# EasyEDA Pro project CAN Bus IO Module.epro, board PCB_PCB_Automotive-Dashboard_2025-10-05_1
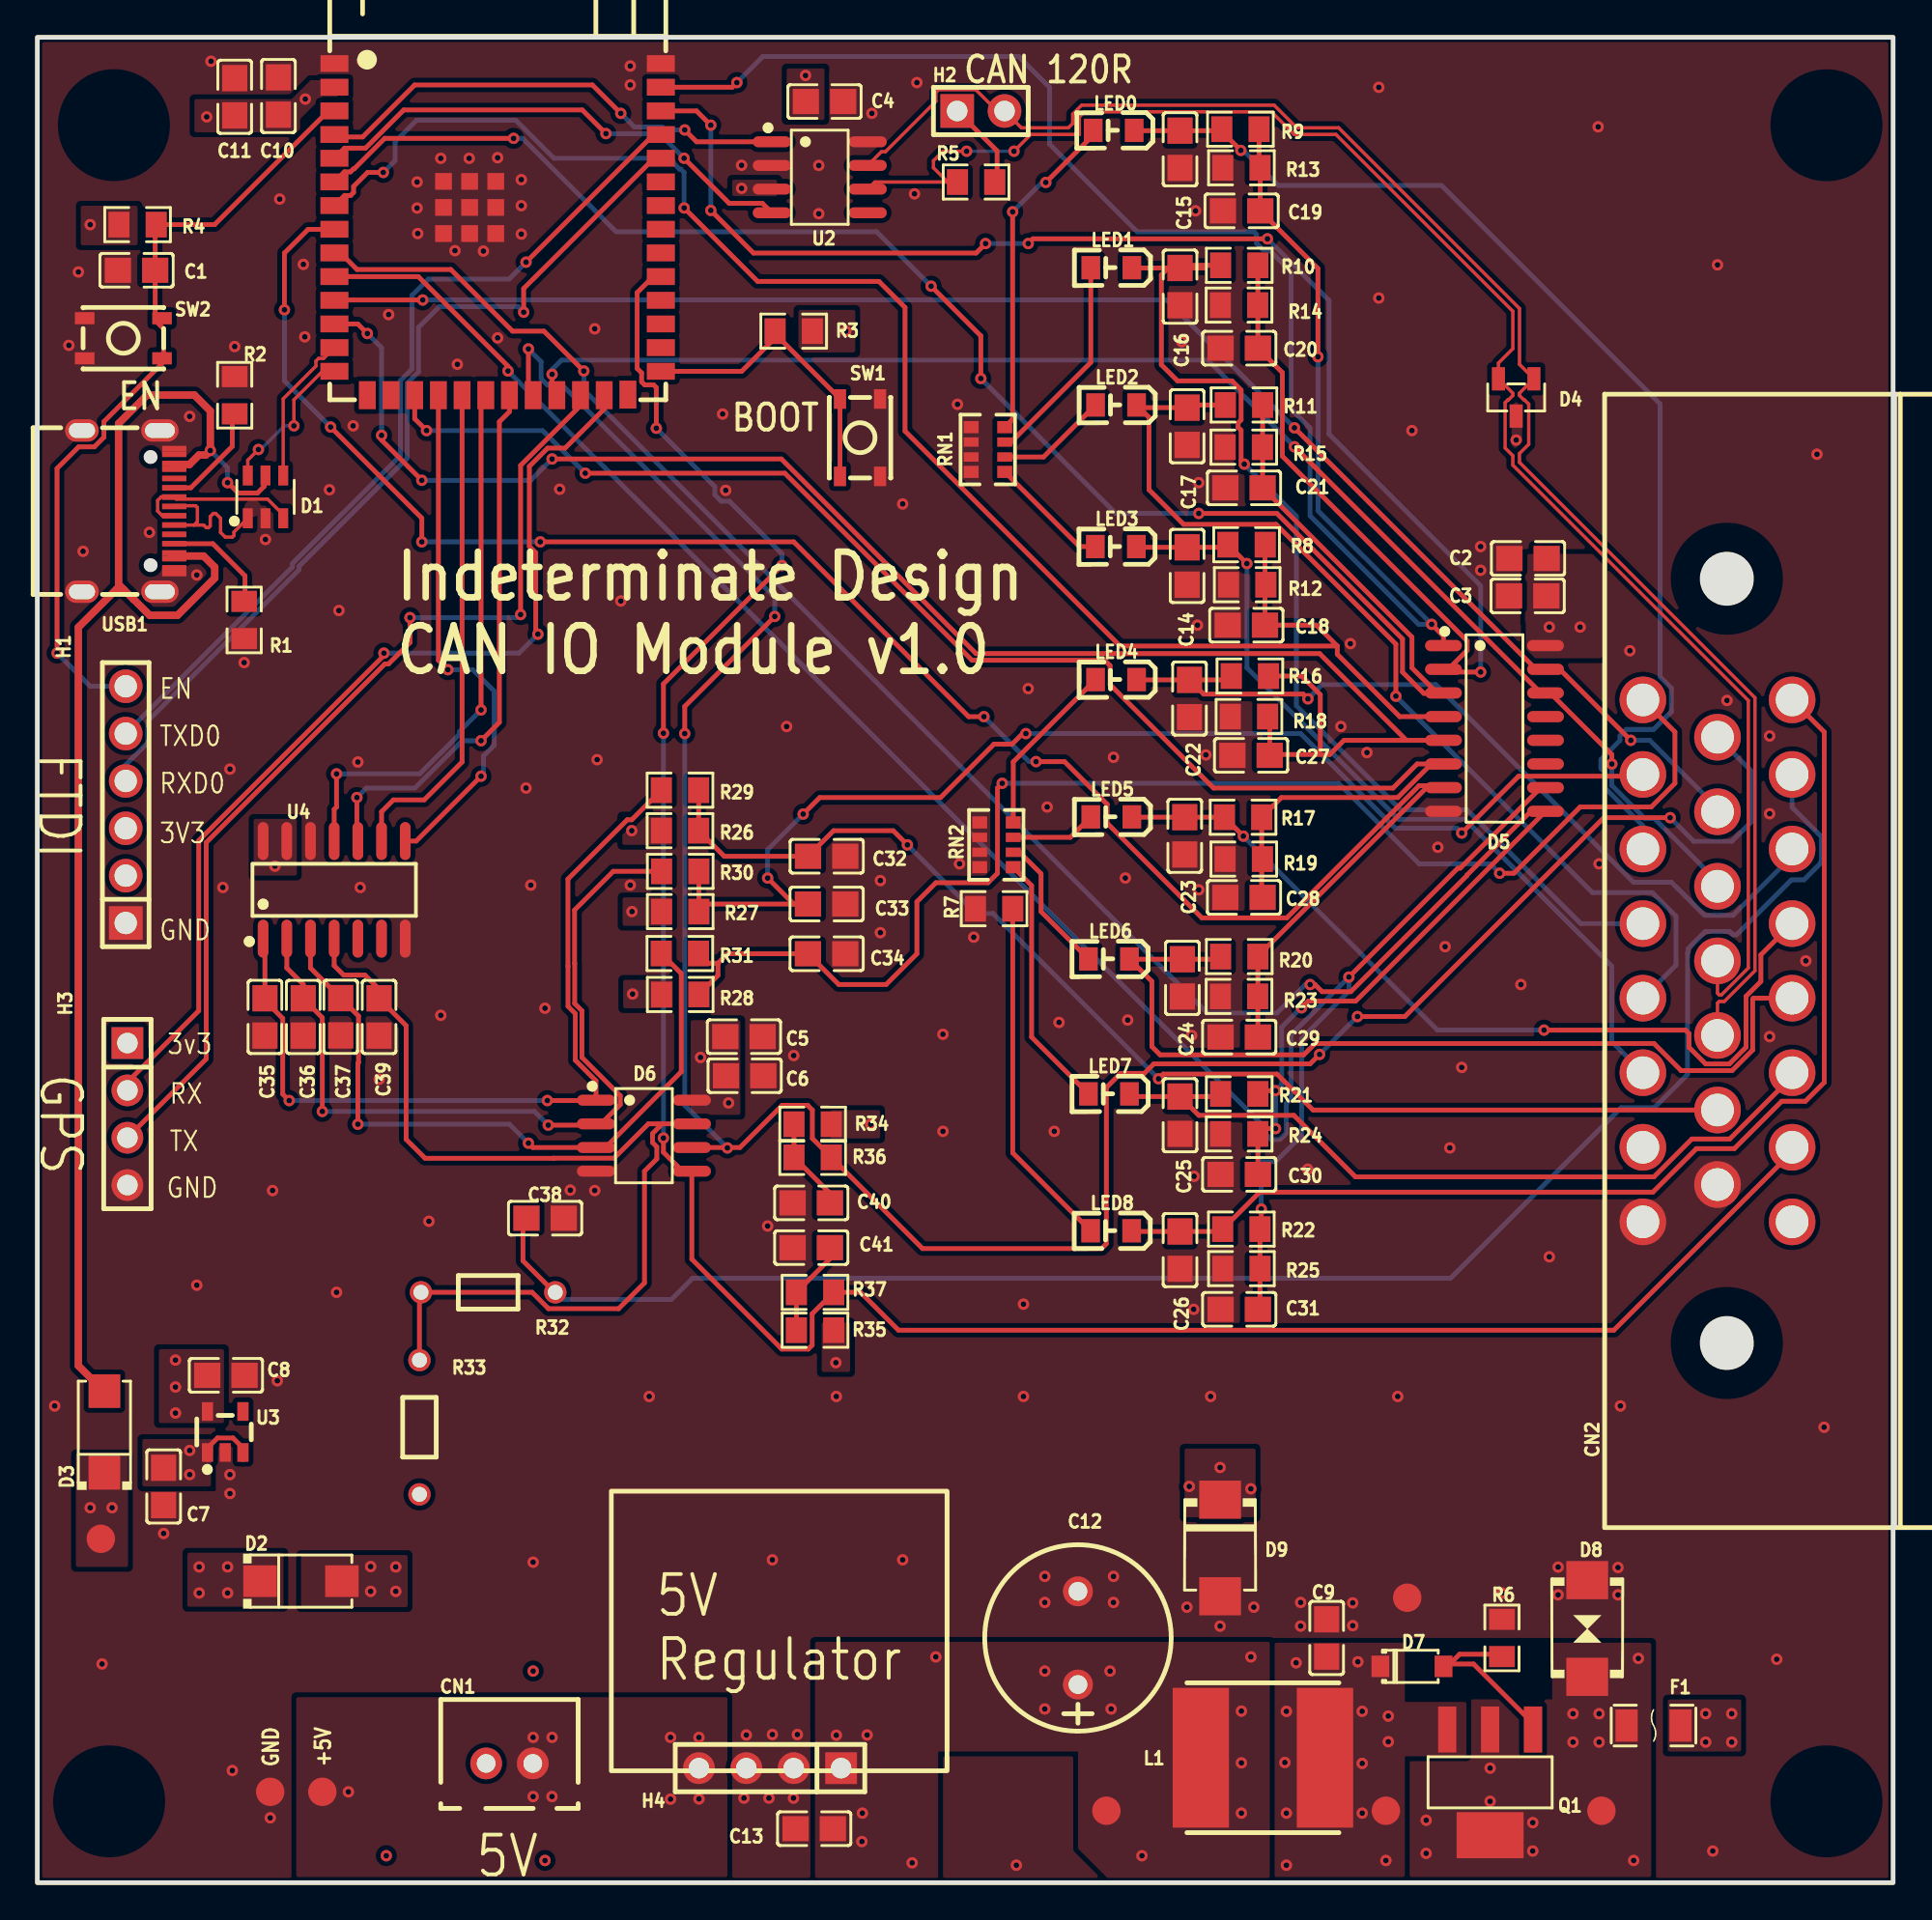
[diagram p6: board, top side]
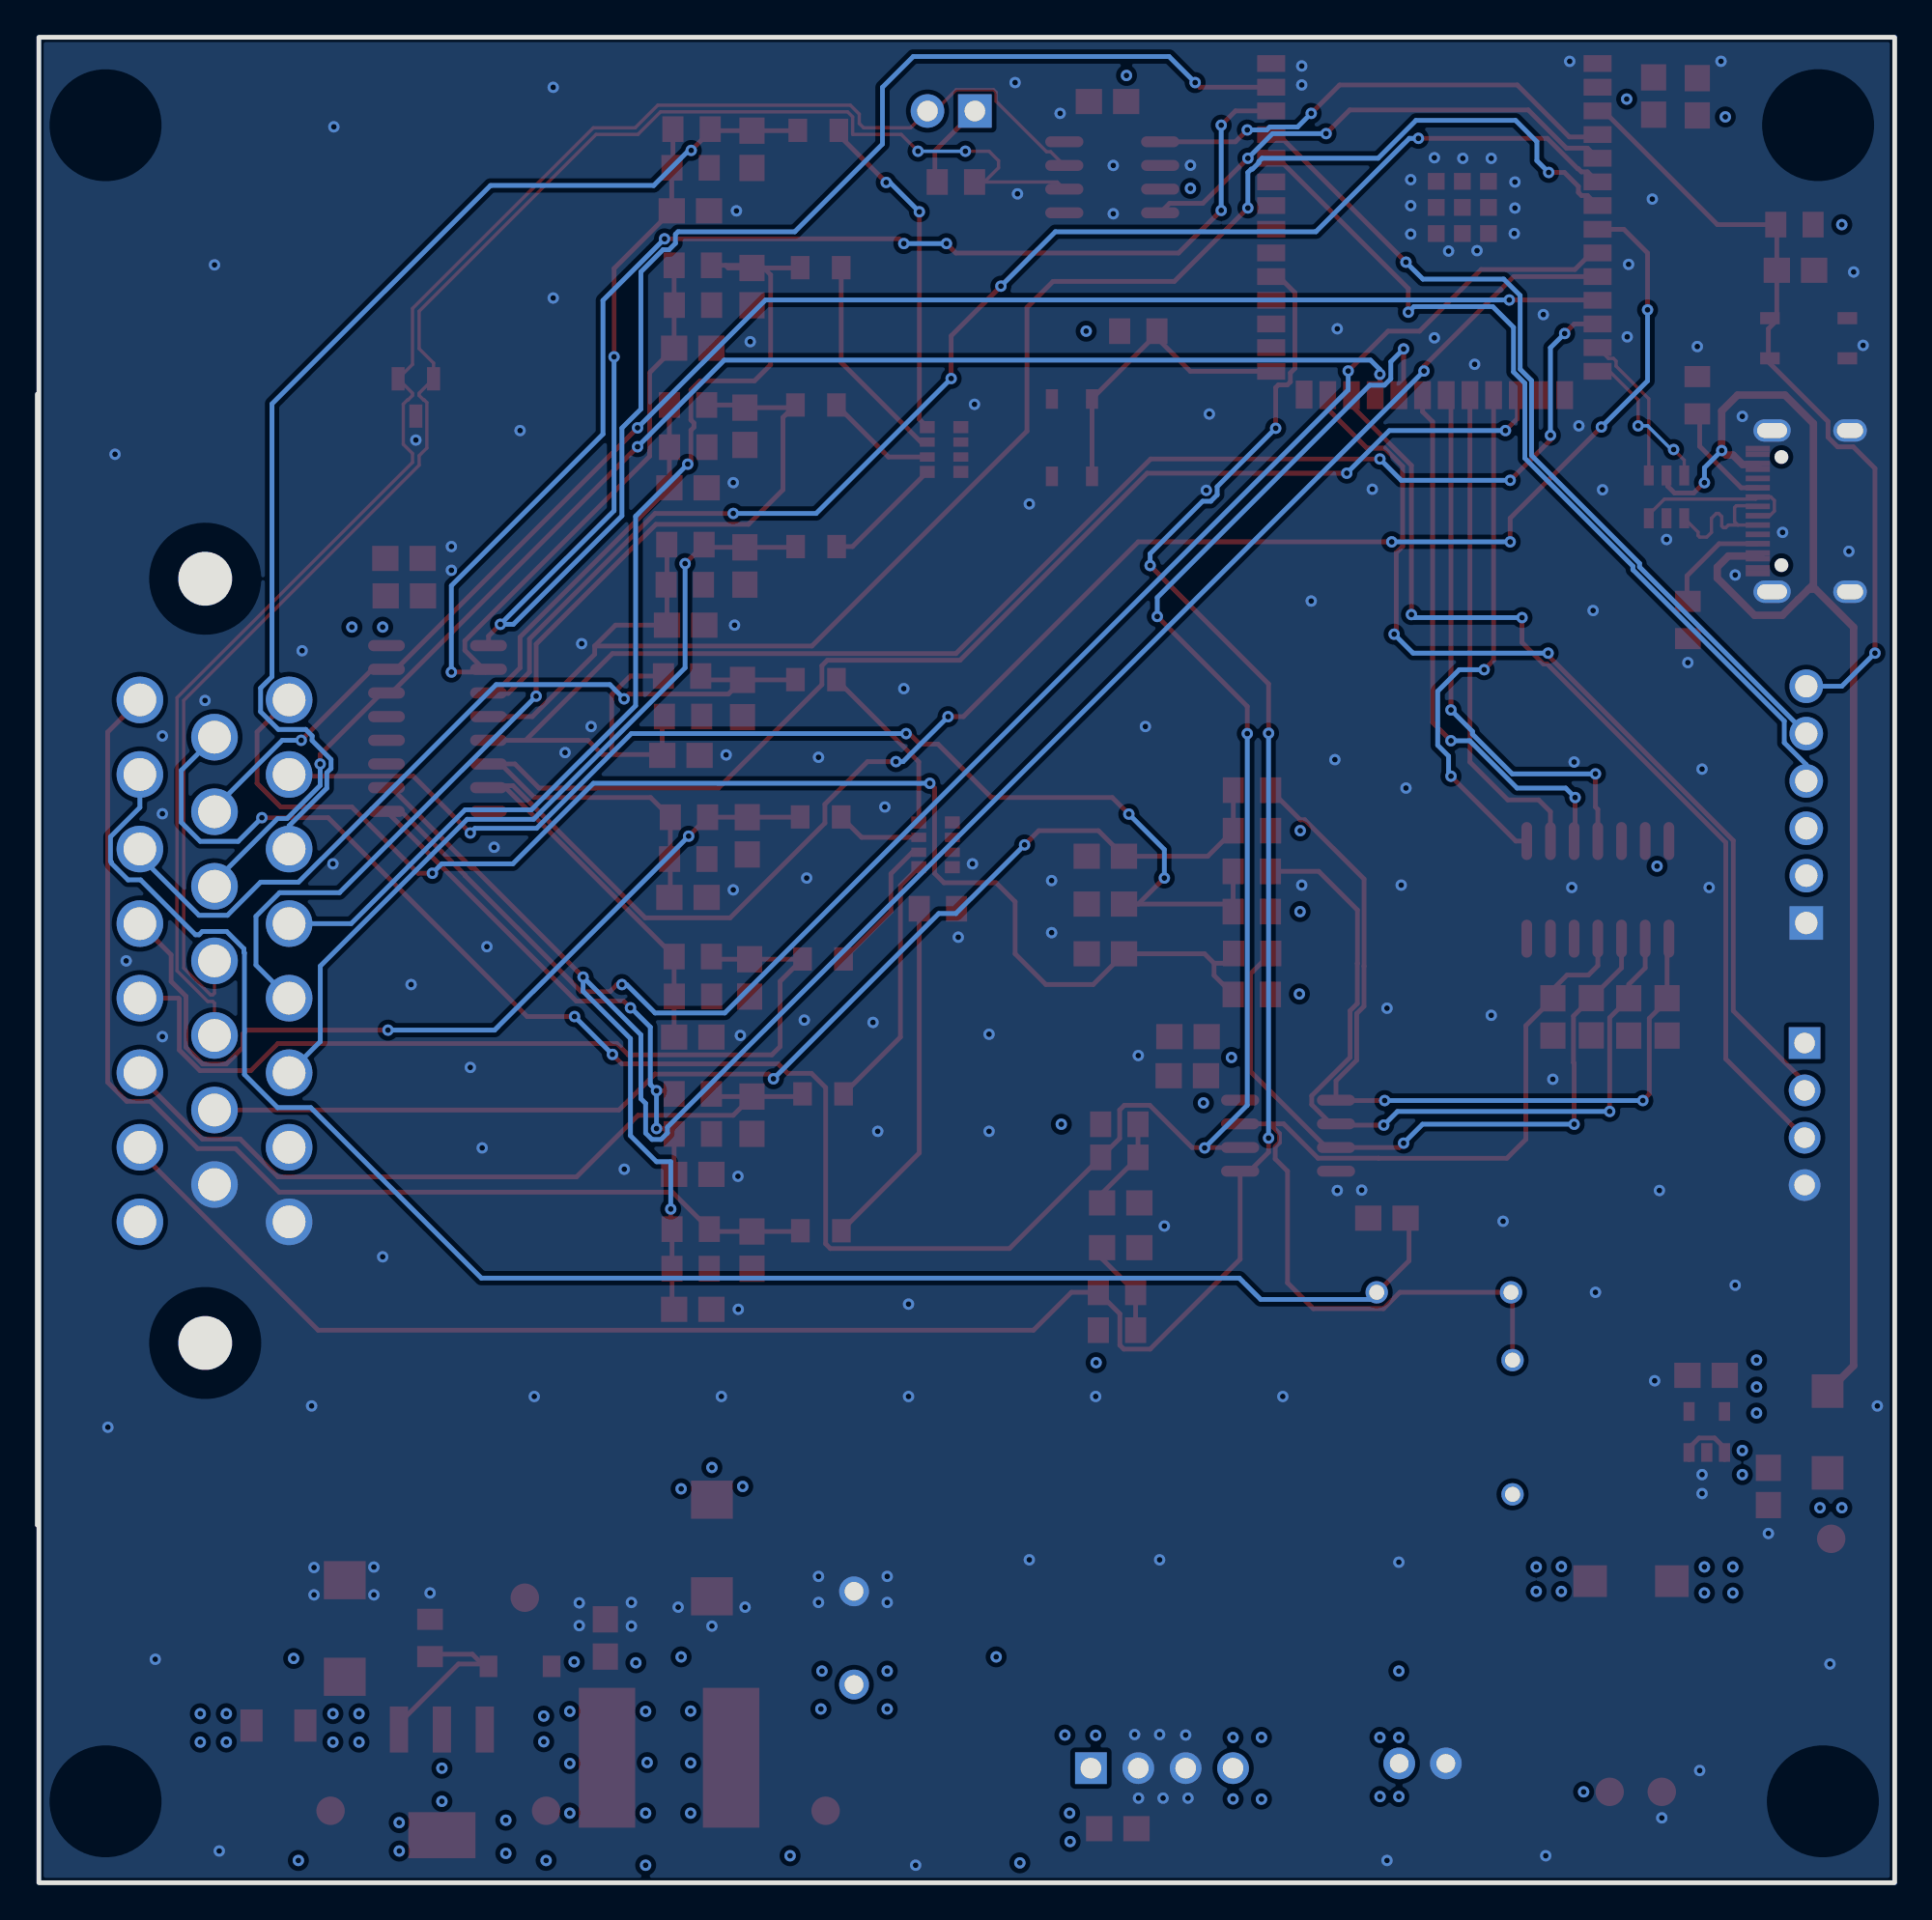
[diagram p7: board, bottom side, seen from below]

Outline 99.58 x 99 mm; copper layers: Top Layer, Inner1, Inner2, Bottom Layer. Coordinates in mm from the lower left corner of the outline.
Outline path: rectangle 0,99 99.5,0
Stack: Top Layer 0.035mm Outer layer thickness 1oz / Dielectric1 0.2104mm 7628 RC49% 8.6mil / Inner1 0.0152mm Inner layer thickness / Dielectric2 1.065mm 1.1mm H/HOZ Copper / Inner2 0.0152mm Inner layer thickness / Dielectric3 0.2104mm 7628 RC49% 8.6mil / Bottom Layer 0.035mm Outer layer thickness 1oz

## Design rules (mm)
net CAN_H: CAN_BUS
net CAN_L: CAN_BUS
net USB_D+: USB_D
net USB_D-: USB_D
net USB_D-_PROTECTED: USB_D_Protected
net USB_D+_PROTECTED: USB_D_Protected
template: Custom Config
spacing copperThickness1oz (default): track to track 0.102, other pairs 0.152 to 0.3
spacing copperThickness2oz: track to track 0.203, other pairs 0.152 to 0.3
track width copperThickness1oz (default): min 0.127, default 0.254, max 2.54
track width copperThickness2oz: min 0.203, default 0.254, max 2.54
track width 12V_High_Current: min 0.5, default 0.5, max 2
differential pair differentialPairCAN (default): width min 0.178, default 0.178, max 0.178; gap min 0.178, default 0.178
via viaSize (default): diameter min 0.5, default 0.61, max 10; hole min 0.3, default 0.305, max 6.3
net +12VIGN uses 12V_High_Current

## Placement (name value [footprint] x y rotation side)
C1  100nF  [C0805]  5.32 86.5 180 top
C2  47uF  [C0805]  79.92 71.04 180 top
C3  100nF  [C0805]  79.91 69.03 180 top
C4  100nF  [C0805]  42.21 95.55 0 top
C5  47uF  [C0805]  37.89 45.39 0 top
C6  100nF  [C0805]  37.92 43.29 0 top
C7  100nF  [C0805]  6.77 21.26 90 top
C8  100nF  [C0805]  10.11 27.22 180 top
C9  100nF  [C0805]  69.13 13.13 270 top
C10  100nF  [C0805]  12.93 95.85 270 top
C11  47uF  [C0805]  10.58 95.81 270 top
C12  220uF  [CAP-TH_BD10.0-P5.00-D0.6-FD_ERG50V220M10X13]  55.8 13.13 90 top
C13  100nF  [C0805]  41.65 2.9 0 top
C14  100nF  [C0805]  61.65 70.64 90 top
C15  100nF  [C0805]  61.27 92.99 90 top
C16  100nF  [C0805]  61.27 85.62 90 top
C17  100nF  [C0805]  61.65 78.13 90 top
C18  220nF  [C0805]  64.82 67.46 0 top
C19  220nF  [C0805]  64.57 89.69 0 top
C20  220nF  [C0805]  64.44 82.32 0 top
C21  220nF  [C0805]  64.7 74.83 0 top
C22  100nF  [C0805]  61.77 63.53 90 top
C23  100nF  [C0805]  61.52 56.16 90 top
C24  100nF  [C0805]  61.39 48.54 90 top
C25  100nF  [C0805]  61.27 41.17 90 top
C26  100nF  [C0805]  61.27 33.94 90 top
C27  220nF  [C0805]  65.08 60.48 0 top
C28  220nF  [C0805]  64.7 52.86 0 top
C29  220nF  [C0805]  64.44 45.37 0 top
C30  220nF  [C0805]  64.44 38 0 top
C31  220nF  [C0805]  64.44 30.76 0 top
C32  100nF  [C0805]  42.32 55.07 180 top
C33  100nF  [C0805]  42.32 52.5 180 top
C34  100nF  [C0805]  42.32 49.84 180 top
C35  220nF  [C0805]  12.2 46.45 90 top
C36  220nF  [C0805]  14.26 46.45 90 top
C37  220nF  [C0805]  16.27 46.45 90 top
C38  100nF  [C0805]  27.23 35.65 180 top
C39  220nF  [C0805]  18.32 46.45 90 top
C40  100nF  [C0805]  41.5 36.47 0 top
C41  100nF  [C0805]  41.5 34.07 0 top
CN1  B2B-XH-A(LF)(SN)  [CONN-TH_B2B-XH-A-LF-SN]  25.31 6.4 0 top
CN2  770669-4  [CONN-TH_23P-P4.00-S4.00_770669-4]  90.08 49.45 90 top
D1  USBLC6-2SC6  [SOT-23-6_L2.9-W1.6-P0.95-LS2.8-BL]  12.23 74.34 0 top
D2  B340A-13-F  [SMA_L4.4-W2.6-LS5.0-RD]  14.14 16.18 0 top
D3  B340A-13-F  [SMA_L4.4-W2.6-LS5.0-RD]  3.6 24.18 90 top
D4  SM24CANB-02HTG  [SOT-23-3_L2.9-W1.3-P1.90-LS2.4-BR]  79.29 79.68 90 top
D5  SP720ABG  [SOIC-16_L9.9-W3.9-P1.27-LS6.0-BL]  78.13 61.92 270 top
D6  SP723ABG  [SOIC-8_L4.9-W3.9-P1.27-LS6.0-BL]  32.52 40.08 270 top
D7  BZT52C15  [SOD-123_L2.8-W1.8-LS3.7-RD]  73.7 11.61 0 top
D8  SMBJ26CA  [SMB_L4.3-W3.6-LS5.4-BI]  83.1 13.64 90 top
D9  SMBJ5.0A  [SMB_L4.3-W3.6-LS5.4-RD]  63.42 17.96 270 top
F1  0466003.NRHF  [F1206]  86.66 8.43 180 top
H1  -  [HDR-TH_6P-P2.54-V-M-1]  4.74 57.84 90 top
H2  -  [HDR-TH_2P-P2.54-V-M-1]  50.59 95.05 0 top
H3  -  [HDR-TH_4P-P2.54-V-M]  4.83 41.24 270 top
H4  -  [HDR-TH_4P-P2.54-V-M]  39.29 6.15 180 top
L1  10uH  [IND-SMD_L8.0-W8.0]  65.71 6.7 0 top
LED0  -  [LED0805-RD]  57.71 94.01 180 top
LED1  -  [LED0805-RD]  57.58 86.64 180 top
LED2  -  [LED0805-RD]  57.84 79.27 180 top
LED3  -  [LED0805-RD]  57.83 71.68 180 top
LED4  -  [LED0805-RD]  57.84 64.54 180 top
LED5  -  [LED0805-RD]  57.58 57.18 180 top
LED6  -  [LED0805-RD]  57.46 49.56 180 top
LED7  -  [LED0805-RD]  57.46 42.32 180 top
LED8  -  [LED0805-RD]  57.57 34.98 180 top
NOREF  -  [Pad_e3829]  72.3 3.86 0 top
NOREF#2  -  [Pad_e7244]  3.41 18.45 0 top
NOREF#3  -  [Pad_e7630]  12.49 4.88 0 top
NOREF#4  -  [Pad_e3830]  57.32 3.86 0 top
NOREF#5  -  [Pad_e7629]  15.28 4.88 0 top
NOREF#6  -  [Pad_e3831]  73.45 15.29 0 top
NOREF#7  -  [Pad_e3828]  83.86 3.86 0 top
Q1  DMP6023LE-13  [SOT-223-4_L6.5-W3.5-P2.30-LS7.0-BR]  77.89 5.38 90 top
R1  5.1kΩ  [R0805]  11.09 67.74 90 top
R2  5.1kΩ  [R0805]  10.58 79.8 90 top
R3  10kΩ  [R0805]  40.55 83.23 0 top
R4  10kΩ  [R0805]  5.38 88.95 0 top
R5  120Ω  [R0805]  50.33 91.24 0 top
R6  100kΩ  [R0805]  78.53 13.13 270 top
R7  4.7kΩ  [R0805]  51.3 52.25 180 top
R8  10kΩ  [R0805]  64.84 71.78 180 top
R9  10kΩ  [R0805]  64.51 94.07 180 top
R10  10kΩ  [R0805]  64.44 86.77 180 top
R11  10kΩ  [R0805]  64.7 79.27 180 top
R12  3.3kΩ  [R0805]  64.87 69.63 180 top
R13  3.3kΩ  [R0805]  64.56 92 180 top
R14  3.3kΩ  [R0805]  64.43 84.63 180 top
R15  3.3kΩ  [R0805]  64.68 77.01 180 top
R16  10kΩ  [R0805]  65.01 64.73 180 top
R17  10kΩ  [R0805]  64.65 57.16 180 top
R18  3.3kΩ  [R0805]  64.96 62.56 180 top
R19  3.3kΩ  [R0805]  64.68 54.91 180 top
R20  10kΩ  [R0805]  64.44 49.68 180 top
R21  10kΩ  [R0805]  64.44 42.32 180 top
R22  10kΩ  [R0805]  64.55 35.06 180 top
R23  3.3kΩ  [R0805]  64.43 47.55 180 top
R24  3.3kΩ  [R0805]  64.44 40.17 180 top
R25  3.3kΩ  [R0805]  64.56 32.94 180 top
R26  2.49kΩ  [R0805]  34.46 56.44 180 top
R27  2.49kΩ  [R0805]  34.47 52.1 180 top
R28  2.49kΩ  [R0805]  34.47 47.65 180 top
R29  470Ω  [R0805]  34.46 58.61 180 top
R30  470Ω  [R0805]  34.47 54.26 180 top
R31  470Ω  [R0805]  34.45 49.85 180 top
R32  220Ω  [RES-TH_BD1.8-L3.2-P7.20-D0.4]  24.17 31.67 180 top
R33  470Ω  [RES-TH_BD1.8-L3.2-P7.20-D0.4]  20.49 24.43 270 top
R34  10kΩ  [R0805]  41.57 40.69 0 top
R35  10kΩ  [R0805]  41.7 29.64 0 top
R36  1kΩ  [R0805]  41.57 38.91 0 top
R37  1kΩ  [R0805]  41.7 31.67 0 top
RN1  4.7kΩ  [RES-ARRAY-SMD_0603-8P-L3.2-W1.6-BL]  50.97 76.89 90 top
RN2  4.7kΩ  [RES-ARRAY-SMD_0603-8P-L3.2-W1.6-BL]  51.43 55.68 90 top
SW1  PTS815SJM250SMTRLFS  [KEY-SMD_4P-L4.2-W3.25-P2.15-TL]  44.11 77.52 270 top
SW2  PTS815SJM250SMTRLFS  [KEY-SMD_4P-L4.2-W3.25-P2.15-TL]  4.61 82.85 0 top
U1  2.4GHz  [WIRELM-SMD_ESP32-S3-WROOM-1]  24.68 88.7 0 top
U2  TCAN332DR  [SOIC-8_L4.9-W3.9-P1.27-LS6.0-BL]  41.95 91.49 270 top
U3  AP2112K-3.3TRG1  [SOT-23-5_L2.9-W1.6-P0.95-LS2.8-BR]  10.08 24.18 270 top
U4  MCP3204-CI/SL  [SOIC-14_L8.7-W3.9-P1.27-LS6.0-BL]  15.92 53.26 0 top
USB1  USB-TYPE-C-018  [USB-C_SMD-TYPE-C-31-M-12]  4.87 73.58 270 top

## Footprints (pads in the part's own frame, mm; a bottom-side part is the same pattern mirrored in y, then rotated)
C0805
  rect 1.41x1.35 smd: 1(-1,0) 2(1,0)
CAP-TH_BD10.0-P5.00-D0.6-FD_ERG50V220M10X13
  round 1.6 hole 1: 1(-2.5,0) 2(2.5,0)
CONN-TH_23P-P4.00-S4.00_770669-4
  round 2.5 hole 1.75: 1(-14,4) 2(-10,4) 3(-6,4) 4(-2,4) 5(2,4) 6(6,4) 7(10,4) 8(14,4) 9(-12,0) 10(-8,0) 11(-4,0) 12(0,0) 13(4,0) 14(8,0) 15(12,0) 16(-14,-4) 17(-10,-4) 18(-6,-4) 19(-2,-4) 20(2,-4) 21(6,-4) 22(10,-4) 23(14,-4)
CONN-TH_B2B-XH-A-LF-SN
  round 1.7 hole 1: 1(1.25,0) 2(-1.25,0)
F1206
  rect 1.19x1.728 smd: 1(-1.445,0) 2(1.445,0)
HDR-TH_2P-P2.54-V-M-1
  rect 1.8x1.8 hole 1.1: 1(-1.27,0)
  round 1.8 hole 1.1: 2(1.27,0)
HDR-TH_4P-P2.54-V-M
  rect 1.7x1.7 hole 1.1: 1(-3.81,0)
  round 1.7 hole 1.1: 2(-1.27,0) 3(1.27,0) 4(3.81,0)
HDR-TH_6P-P2.54-V-M-1
  rect 1.8x1.8 hole 1.2: 1(-6.35,0)
  round 1.8 hole 1.2: 2(-3.81,0) 3(-1.27,0) 4(1.27,0) 5(3.81,0) 6(6.35,0)
IND-SMD_L8.0-W8.0
  rect 3.024x7.5 smd: 1(3.328,0) 2(-3.328,0)
KEY-SMD_4P-L4.2-W3.25-P2.15-TL
  rect 1.05x0.65 smd: 1(-2.075,1.075) 2(2.075,1.075) 3(-2.075,-1.075) 4(2.075,-1.075)
LED0805-RD
  rect 1x1.25 smd: 1(-1.1,0) 2(1.1,0)
Pad_e3828
  round 1.524 smd: 1(0,0)
Pad_e3829
  round 1.524 smd: 1(0,0)
Pad_e3830
  round 1.524 smd: 1(0,0)
Pad_e3831
  round 1.524 smd: 1(0,0)
Pad_e7244
  round 1.524 smd: 2(0,0)
Pad_e7629
  round 1.524 smd: 1(0,0)
Pad_e7630
  round 1.524 smd: 2(0,0)
R0805
  rect 1.133x1.377 smd: 1(-1,0) 2(1,0)
RES-ARRAY-SMD_0603-8P-L3.2-W1.6-BL
  rect 0.65x0.8 smd: 1(-1.2,-0.9) 4(1.2,-0.9) 5(1.2,0.9) 8(-1.2,0.9)
  rect 0.5x0.8 smd: 2(-0.4,-0.9) 3(0.4,-0.9) 6(0.4,0.9) 7(-0.4,0.9)
RES-TH_BD1.8-L3.2-P7.20-D0.4
  round 1.2 hole 0.8: 1(-3.6,0) 2(3.6,0)
SMA_L4.4-W2.6-LS5.0-RD
  rect 1.8x1.7 smd: 1(-2.192,0) 2(2.192,0)
SMB_L4.3-W3.6-LS5.4-BI
  rect 2.047x2.241 smd: 1(-2.591,0) 2(2.591,0)
SMB_L4.3-W3.6-LS5.4-RD
  rect 2.047x2.241 smd: 1(-2.591,0) 2(2.591,0)
SOD-123_L2.8-W1.8-LS3.7-RD
  rect 0.95x1.15 smd: 1(-1.692,0) 2(1.692,0)
SOIC-8_L4.9-W3.9-P1.27-LS6.0-BL
  oval 0.588x2.045 smd: 1(-1.905,-2.57) 2(-0.635,-2.57) 3(0.635,-2.57) 4(1.905,-2.57) 5(1.905,2.57) 6(0.635,2.57) 7(-0.635,2.57) 8(-1.905,2.57)
SOIC-14_L8.7-W3.9-P1.27-LS6.0-BL
  oval 0.574x2.038 smd: 1(-3.81,-2.619) 2(-2.54,-2.619) 3(-1.27,-2.619) 4(0,-2.619) 5(1.27,-2.619) 6(2.54,-2.619) 7(3.81,-2.619) 8(3.81,2.619) 9(2.54,2.619) 10(1.27,2.619) 11(0,2.619) 12(-1.27,2.619) 13(-2.54,2.619) 14(-3.81,2.619)
SOIC-16_L9.9-W3.9-P1.27-LS6.0-BL
  oval 0.602x1.971 smd: 1(-4.445,-2.736) 2(-3.175,-2.736) 3(-1.905,-2.736) 4(-0.635,-2.736) 5(0.635,-2.736) 6(1.905,-2.736) 7(3.175,-2.736) 8(4.445,-2.736) 9(4.445,2.736) 10(3.175,2.736) 11(1.905,2.736) 12(0.635,2.736) 13(-0.635,2.736) 14(-1.905,2.736) 15(-3.175,2.736) 16(-4.445,2.736)
SOT-23-3_L2.9-W1.3-P1.90-LS2.4-BR
  rect 1.25x0.7 smd: 1(1,-0.95) 2(1,0.95) 3(-1,0)
SOT-23-5_L2.9-W1.6-P0.95-LS2.8-BR
  rect 1x0.6 smd: 1(1.1,-0.95) 2(1.1,0) 3(1.1,0.95) 4(-1.1,0.95) 5(-1.1,-0.95)
SOT-23-6_L2.9-W1.6-P0.95-LS2.8-BL
  rect 0.532x1.072 smd: 1(-0.95,-1.149) 2(0,-1.149) 3(0.95,-1.149) 4(0.95,1.149) 5(0,1.149) 6(-0.95,1.149)
SOT-223-4_L6.5-W3.5-P2.30-LS7.0-BR
  rect 2.47x0.98 smd: 1(2.835,-2.3) 2(2.835,0) 3(2.835,2.3)
  rect 2.47x3.6 smd: 4(-2.835,0)
USB-C_SMD-TYPE-C-31-M-12
  oval 1.2x2 hole 0.8x1.6: 0(-4.325,1.706) 1(4.325,1.706)
  oval 1.2x1.8 hole 0.8x1.4: 2(4.325,-2.474) 3(-4.325,-2.474)
  rect 0.3x1.3 smd: A1(-3.35,2.474) A4(-2.55,2.474) A5(-1.25,2.474) A6(-0.25,2.474) A7(0.25,2.474) A8(1.25,2.474) A9(2.55,2.474) A12(3.35,2.474) B1(3.05,2.474) B4(2.25,2.474) B5(1.75,2.474) B6(0.75,2.474) B7(-0.75,2.474) B8(-1.75,2.474) B9(-2.25,2.474) B12(-3.05,2.474)
WIRELM-SMD_ESP32-S3-WROOM-1
  rect 1.5x0.9 smd: 1(-8.75,8.895) 2(-8.75,7.625) 3(-8.75,6.355) 4(-8.75,5.085) 5(-8.75,3.815) 6(-8.75,2.545) 7(-8.75,1.275) 8(-8.75,0.005) 9(-8.75,-1.265) 10(-8.75,-2.535) 11(-8.75,-3.805) 12(-8.75,-5.075) 13(-8.75,-6.345) 14(-8.75,-7.615) 27(8.75,-7.615) 28(8.75,-6.345) 29(8.75,-5.075) 30(8.75,-3.805) 31(8.75,-2.535) 32(8.75,-1.265) 33(8.75,0.005) 34(8.75,1.275) 35(8.75,2.545) 36(8.75,3.815) 37(8.75,5.085) 38(8.75,6.355) 39(8.75,7.625) 40(8.75,8.895)
  rect 0.9x1.5 smd: 15(-6.985,-8.895) 16(-5.715,-8.895) 17(-4.445,-8.895) 18(-3.175,-8.895) 19(-1.905,-8.895) 20(-0.635,-8.895) 21(0.635,-8.895) 22(1.905,-8.895) 23(3.175,-8.895) 24(4.445,-8.895) 25(5.715,-8.895) 26(6.985,-8.865)
  rect 0.9x0.9 smd: 41(-2.9,2.575) 41(-2.9,1.175) 41(-2.9,-0.225) 41(-1.5,2.575) 41(-1.5,1.175) 41(-1.5,-0.225) 41(-0.1,2.575) 41(-0.1,1.175) 41(-0.1,-0.225)

## Nets
As in the schematic, except:
+5V: CN1.1 CN2.2 D2.2 D9.1 H4.4 NOREF#5.1 R33.2
+12VFUSED: D8.1 F1.2 NOREF#7.1 Q1.2 Q1.4
+12VPROTECTED: C9.2 D7.1 L1.1 NOREF.1 Q1.3
+12VPROTECTED_L: C12.1 C13.2 H4.1 L1.2 NOREF#4.1
GND: C1.2 C2.2 C3.2 C4.2 C5.2 C6.2 C7.1 C8.1 C9.1 C10.1 C11.1 C12.2 C13.1 C14.1 C15.1 C16.1 C17.1 C18.1 C19.1 C20.1 C21.1 C22.1 C23.1 C24.1 C25.1 C26.1 C27.1 C28.1 C29.1 C30.1 C31.1 C32.1 C33.1 C34.1 C35.1 C36.1 C37.1 C38.1 C39.1 C40.1 C41.1 CN1.2 CN2.1 CN2.9 D1.2 D4.3 D5.8 D6.4 D8.2 D9.2 H1.1 H3.4 H4.2 H4.3 NOREF#3.2 NOREF#6.1 R1.1 R2.2 R6.1 R7.2 R12.2 R13.2 R14.2 R15.2 R18.2 R19.2 R23.2 R24.2 R25.2 RN1.5 RN1.6 RN1.7 RN1.8 RN2.5 RN2.6 RN2.7 RN2.8 SW1.1 SW1.2 SW2.1 SW2.3 U1.1 U1.40 U1.41 U2.2 U2.8 U3.2 U4.7 U4.12 USB1.0 USB1.1 USB1.2 USB1.3 USB1.A1 USB1.A12 USB1.B1 USB1.B12
+5LDO: C7.2 D2.1 D3.1 NOREF#2.2 U3.1 U3.3

Pads without a net: D5 11 12 13; H1 2; U1 15 16 26 28 29 30 32 33 34 35; U2 5; U3 4; U4 5 6; USB1 A8 B8

## Via types
v1: diameter 0.61, hole 0.305, Top Layer to Bottom Layer, 345 vias

## Routing (per net, layer and track width the routed paths; a pad name or vN(x,y) marks a point on that pad's centre or on a via; arc(x,y) is an arc through that point)
+3V3:
  vias: v1(2.84,88.95) v1(7.41,28.04) v1(7.41,26.59) v1(7.41,25.2) v1(9.08,94.73) v1(12.74,54.53) v1(14.37,95.69) v1(31.87,56.44) v1(31.88,52.1) v1(31.92,47.67) v1(35.56,44.27) v1(37.06,41.83) v1(37.76,90.9) v1(41.19,96.95) v1(42.82,27.9) v1(43.35,83.23) v1(44.68,40.69) v1(81.07,67.36) v1(82.72,67.36)
+5V:
  vias: v1(16.68,4.88) v1(17.87,16.96) v1(17.87,15.63) v1(19.22,16.94) v1(19.22,15.63) v1(26.58,11.35) v1(26.58,7.8) v1(26.58,4.62) v1(27.6,7.8) v1(27.59,4.62) v1(33.95,7.8) v1(33.95,4.48) v1(35.48,7.79) v1(35.48,4.5) v1(61.76,21.26) v1(63.42,22.28) v1(65.07,21.13)
+12VFUSED:
  vias: v1(74.46,3.35) v1(74.46,1.57) v1(77.89,6.15) v1(77.89,4.37) v1(80.18,3.22) v1(80.18,1.7) v1(82.34,9.07) v1(82.34,7.54) v1(83.73,9.07) v1(83.73,7.54) v1(85.59,1.19) v1(85.84,12.03)
+12VIGN:
  vias: v1(89.45,9.07) v1(89.45,7.54) v1(90.85,9.07) v1(90.85,7.54)
+12VPROTECTED:
  vias: v1(66.89,6.45) v1(66.97,9.19) v1(66.97,3.73) v1(66.97,0.94) v1(67.49,11.8) v1(70.8,11.85) v1(71.04,9.19) v1(71.04,6.4) v1(71.04,3.73) v1(72.3,1.19) v1(72.43,8.94) v1(72.43,7.56)
+12VPROTECTED_L:
  vias: v1(42.84,7.91) v1(44.24,3.73) v1(44.21,2.21) v1(44.49,7.92) v1(46.9,1.07) v1(48.17,12.12) v1(54.02,11.35) v1(54.02,9.32) v1(57.52,11.35) v1(57.57,9.32) v1(59.22,1.45) v1(64.56,9.21) v1(64.56,6.43) v1(64.56,3.73) v1(65.07,12.12)
GND:
  vias: v1(0.93,25.58) v1(1.69,82.47) v1(2.2,86.41) v1(2.45,71.42) v1(3.47,11.73) v1(6.01,72.44) v1(6.77,18.74) v1(8.17,78.66) v1(8.55,70.15) v1(8.55,32.05) v1(9.31,97.71) v1(9.95,53.39) v1(10.33,59.74) v1(10.33,21.89) v1(10.33,20.88) v1(10.46,6.02) v1(10.58,82.41) v1(11.09,65.45) v1(12.23,72.06) v1(12.49,3.48) v1(12.61,37.13) v1(12.87,26.93) v1(13,90.32) v1(14.27,86.82) v1(14.34,82.93) v1(15.66,74.73) v1(16.04,31.67) v1(16.17,68.25) v1(16.93,78.16) v1(17.19,60.12) v1(17.31,53.39) v1(17.43,97.71) v1(18.33,43.1) v1(18.71,1.45) v1(18.84,84.12) v1(20.36,91.24) v1(20.36,89.84) v1(20.4,88.47) v1(21,35.48) v1(21.63,92.51) v1(21.63,46.53) v1(22.39,87.55) v1(22.52,81.46) v1(23.16,92.51) v1(23.92,87.53) v1(24.68,92.54) v1(24.68,82.88) v1(25.95,91.36) v1(25.95,89.97) v1(25.95,88.44) v1(26.2,58.72) v1(26.46,53.52) v1(26.58,17.19) v1(27.22,46.91) v1(27.22,1.19) v1(28.01,74.76) v1(28.58,37.16) v1(29.89,83.36) v1(29.89,37.13) v1(30.01,60.25) v1(31.28,68.76) v1(31.79,97.46) v1(31.79,96.44) v1(31.79,53.52) v1(32.81,26.09) v1(36.74,78.79) v1(36.91,74.7) v1(37.76,92.13) v1(37.89,4.54) v1(38.02,7.92) v1(39.16,35.23) v1(39.23,4.54) v1(39.41,17.32) v1(39.41,7.95) v1(40.17,62.03) v1(40.54,4.54) v1(40.55,44.37) v1(40.75,7.95) v1(41.9,92.12) v1(41.9,89.53) v1(42.84,26.09) v1(44.75,94.92) v1(45.2,53.76) v1(45.2,50.97) v1(46.4,73.96) v1(46.4,17.32) v1(47.03,90.6) v1(47.16,96.57) v1(48.56,45.52) v1(48.56,40.31) v1(49.34,79.31) v1(49.45,54.66) v1(50.21,50.72) v1(52.49,0.94) v1(52.87,31.04) v1(52.87,26.09) v1(53.13,64.06) v1(54.02,16.43) v1(54.02,15.04) v1(54.14,57.71) v1(54.52,40.31) v1(54.78,46.15) v1(57.7,60.38) v1(57.7,16.43) v1(57.7,15.04) v1(58.33,53.9) v1(58.46,46.28) v1(61.36,82.67) v1(61.64,14.78) v1(61.89,45.45) v1(62.02,37.9) v1(62,30.76) v1(62.1,89.69) v1(62.2,67.46) v1(62.27,75.11) v1(62.27,53.26) v1(62.65,60.5) v1(62.91,26.09) v1(63.42,13.77) v1(65.22,14.78) v1(67.73,15.04) v1(67.73,13.77) v1(68.11,38.28) v1(69.89,62.03) v1(70.4,66.47) v1(70.53,15.01) v1(70.53,13.79) v1(71.29,60.63) v1(71.92,96.32) v1(71.92,85.01) v1(72.94,26.09) v1(73.7,77.9) v1(75.09,55.55) v1(75.48,50.22) v1(75.73,39.42) v1(76.37,43.74) v1(77.39,71.68) v1(77.39,70.41) v1(78.53,15.54) v1(79.29,77.39) v1(79.54,48.18) v1(81.07,33.58) v1(81.54,16.93) v1(81.54,15.44) v1(83.69,94.2) v1(83.73,54.66) v1(84.75,16.91) v1(84.75,15.44) v1(84.88,25.58) v1(85.39,66.09) v1(89.83,1.7) v1(90.08,86.79) v1(90.59,63.42) v1(92.88,61.52) v1(92.88,57.35) v1(92.88,45.39) v1(93.26,11.99) v1(94.82,49.45) v1(95.42,76.63) v1(95.8,24.43)
VBUS: length 78.2
  Top Layer w0.254: 12.17,75.3 12.17,74.92 11.81,74.55 10.78,74.55 10.22,75.11 v1(10.2,75.11)
  Top Layer w0.4: 4.61,69.39 4.25,69.39 2.2,67.35 2.2,27.74 3.47,26.47 ; 4.61,69.39 5.16,68.84 5.17,68.84 6.02,67.99 7.52,67.99 9.51,69.99 9.51,70.57 8.92,71.17 7.18,71.17 ; 4.61,69.39 4.36,69.65 4.36,78.28 5.88,79.81 8.42,79.81 9.28,78.95 v1(9.28,76.83) 9.03,76.59 8.67,76.59 8.16,76.08 7.34,76.08
  Bottom Layer w0.254: v1(10.2,75.11) 10.2,75.91 v1(9.28,76.83)
+5LDO: length 3.6
  Top Layer w0.254: 11.02,22.7 11.09,22.77 11.09,23.26 10.49,23.86 9.66,23.86 9.12,23.33 9.12,22.7
  vias: v1(2.84,20.12) v1(4.01,20.12) v1(8.17,23.19) v1(8.17,21.89) v1(8.68,16.94) v1(8.68,15.54) v1(10.2,16.94) v1(10.2,15.54)
ADC0: length 45.2
  Top Layer w0.254: U4.1 12.2,50.55 12.2,47.32 13.16,46.37 13.16,42.31 v1(13.5,41.96) ; R29.2 31.87,57.02 31.63,57.02 28.45,53.84 28.45,49.17 28.46,49.16 28.46,47.02 28.84,46.63 28.84,44.13 29.95,43.02 D6.1 29.93,41.96 v1(27.35,41.96)
  Bottom Layer w0.254: v1(13.5,41.96) v1(27.35,41.96)
ADC1: length 43.8
  Top Layer w0.254: v1(27.39,40.64) 29.89,40.64 D6.2 30.22,40.71 31.26,41.74 31.26,42.22 29.2,44.27 29.2,46.77 28.81,47.16 28.81,49.31 28.81,49.32 28.81,52.18 30.88,54.26 R30.2 ; U4.2 13.38,49.07 14.26,48.19 14.26,47.43 15.28,46.41 v1(15.28,41.38)
  Bottom Layer w0.254: v1(15.28,41.38) 26.66,41.38 v1(27.39,40.64)
ADC2: length 37.4
  Top Layer w0.254: v1(17.19,40.69) 17.19,43.96 17.22,44 17.22,46.5 14.65,49.07 U4.3 ; R31.2 34.53,48.77 34.53,43.5 30.46,39.44 D6.3 26.56,39.44 v1(26.33,39.67)
  Bottom Layer w0.254: v1(17.19,40.69) 25.31,40.69 v1(26.33,39.67)
ADC3: length 55.5
  Top Layer w0.254: 33.51,40.71 32.76,40.71 30.92,38.87 27.67,38.87 27.66,38.86 20.79,38.86 19.77,39.88 19.77,45.98 18.32,47.43 18.32,47.94 17.57,48.69 16.42,48.69 15.92,49.2 U4.4 ; 33.51,40.71 D6.7 ; 33.51,40.71 32.99,40.19 32.99,39.71 33.21,39.48 33.21,38.83 32.55,38.17 32.55,32.18 31.17,30.79 27.41,30.79 26.53,31.67 R32.2 20.49,31.59 20.49,28.03
  Bottom Layer w0.254: 20.54,28.18 20.39,28.03
ANALOGIN0: length 64.4
  Top Layer w0.254: R29.1 R26.1 36.83,55.07 C32.2 42.69,56.44 45.89,56.44 v1(46.65,55.68) ; CN2.10 68.4,41.45 66.47,43.38 60.37,43.38 v1(60.12,43.13)
  Bottom Layer w0.254: v1(46.65,55.68) 50.33,51.99 51.25,51.99 v1(60.12,43.13)
ANALOGIN1: length 64.7
  Top Layer w0.254: v1(41.06,57.33) 41.95,58.22 48.43,58.22 51.3,61.08 52.27,61.08 52.83,61.65 v1(53,61.65) ; 40.55,52.5 35.87,52.5 R27.1 R30.1 ; 40.55,52.5 C33.2 ; 40.55,52.5 v1(39.16,53.9) ; CN2.7 85.99,59.36 79.42,59.36 v1(76.37,56.31)
  Bottom Layer w0.254: v1(39.16,53.9) 39.16,55.42 v1(41.06,57.33) ; v1(76.37,56.31) 76.12,56.57 72.82,56.57 67.74,61.65 v1(53,61.65)
ANALOGIN2: length 73.5
  Top Layer w0.254: 36.49,49.33 36.49,48.68 R28.1 ; 36.49,49.33 35.97,49.33 R31.1 ; 36.49,49.33 37,49.84 C34.2 42.97,48.18 45.51,48.18 47.16,49.83 47.16,52.63 48.18,53.65 50.97,53.65 51.48,54.15 51.48,58.73 v1(51.73,58.98) ; CN2.8 87.8,61.74 87.8,58.98 86.53,57.71 82.72,57.71 79.17,54.15 v1(78.4,54.15)
  Bottom Layer w0.254: v1(51.73,58.98) 69.77,58.98 74.09,54.66 77.9,54.66 v1(78.4,54.15)
BOOT: length 16.5
  Top Layer w0.254: 39.67,82.98 39.67,83.12 R3.1 ; 39.67,82.98 43.22,79.42 ; 39.67,82.98 37.77,81.08 U1.27 ; 43.04,79.21 43.04,75.06
BUTTON_0: length 136.9
  Top Layer w0.254: D6.6 37.02,39.44 ; 37.02,39.44 v1(37,39.42) ; 37.02,39.44 37.67,39.44 39.94,41.71 41.3,41.71 41.55,41.45 41.55,39.93 R36.2 47.46,34.02 57.07,34.02 57.32,34.28 57.32,42.66 58.08,43.42 59.35,43.42 59.86,43.93 68.24,43.93 v1(68.75,44.44) ; v1(26.33,82.28) 26.33,80.06 U1.22 ; v1(39.54,67.93) 34.71,63.1 v1(34.71,61.65) ; v1(87.55,57.14) 83.99,57.14 73.32,46.47 v1(70.78,46.47)
  Bottom Layer w0.254: v1(37,39.42) 34.71,41.71 v1(34.71,61.65) ; v1(39.54,67.93) 39.54,68.95 28.15,80.34 27.36,80.34 27.02,80.68 27.02,81.59 v1(26.33,82.28) ; v1(87.55,57.14) 88.82,55.87 90.85,55.87 91.86,56.88 91.86,59.67 CN2.15 ; v1(70.78,46.47) v1(68.75,44.44)
BUTTON_1: length 129.1
  Top Layer w0.254: CN2.17 94.08,39.2 84.53,29.64 46.17,29.64 44.14,31.67 R37.2 41.54,30.52 41.54,28.84 41.33,28.62 39.92,28.62 35.09,33.45 D6.5 34.59,38.17 33.57,39.19 v1(33.57,39.95) ; U1.31 33.33,86.06 32.92,86.06 32.16,85.3 32.16,81.24 32.4,81 32.4,80.52 32.56,80.35 33.05,80.35 33.19,80.21 v1(33.19,78.03) ; v1(33.57,61.67) 33.57,64.31 v1(39.92,70.66)
  Bottom Layer w0.254: v1(33.19,78.03) 36.33,74.89 36.33,74.45 36.67,74.11 37.11,74.11 39.92,71.3 v1(39.92,70.66) ; v1(33.57,39.95) v1(33.57,61.67)
CAN_H: length 89.4
  Top Layer w0.178: CN2.11 90.08,47.19 90.17,47.28 90.45,47.28 92.09,48.92 92.09,63.57 79.47,76.19 79.47,76.67 79.96,77.17 79.96,79.32 79.74,79.55 79.7,79.55 79.47,79.78 79.47,79.91 D4.1 79.47,81.45 79.47,84.45 69.77,94.14 67.53,94.14 66.32,95.36 55.99,95.36 55.51,94.88 55.51,94.38 55.28,94.14 52.76,94.14 H2.2 51.46,95.05 50.32,96.19 48.32,96.19 48.18,96.05 48.18,95.56 45.47,92.86 45.26,92.86 44.52,92.12
CAN_L: length 89.2
  Top Layer w0.178: v1(52.37,92.89) 53.27,93.79 55.87,93.79 55.87,94.73 56.14,95 66.17,95 67.38,93.79 69.63,93.79 79.11,84.3 79.11,82.3 78.34,81.52 78.34,80.68 79.11,79.91 79.11,79.78 78.87,79.55 78.84,79.55 78.7,79.4 78.7,76.97 79.11,76.56 79.11,76.05 91.74,63.42 91.74,49.07 90.3,47.63 90.17,47.63 90.08,47.72 CN2.12 ; 49.46,91.24 48.81,91.24 ; 48.81,91.24 48.05,92 48.05,92.38 48.56,92.89 v1(49.83,92.89) ; 48.81,91.24 44.9,91.24 44.52,90.86
  Bottom Layer w0.178: v1(49.83,92.89) v1(52.37,92.89)
CAN_RX: length 26.8
  Top Layer w0.254: U2.4 38.87,90.09 37.1,90.09 v1(34.68,92.51) ; v1(30.49,93.83) 29.22,95.1 19.65,95.1 17.6,93.05 16.47,93.05 U1.5
  Bottom Layer w0.254: v1(34.68,92.51) 33.36,93.83 v1(30.49,93.83)
CAN_TX: length 25.9
  Top Layer w0.254: v1(34.71,94.03) 35.35,93.4 U2.1 ; v1(31.28,94.92) 29.76,96.44 20.23,96.44 17.45,93.65 16.06,93.65 U1.4
  Bottom Layer w0.254: v1(34.71,94.03) 33.66,94.03 33.5,94.19 32.02,94.19 v1(31.28,94.92)
CS: length 28.3
  Top Layer w0.254: U4.8 20.31,55.88 v1(23.79,59.36) ; U1.18 21.5,65.58 v1(22.01,65.07)
  Bottom Layer w0.254: v1(22.01,65.07) 23.35,65.07 24.5,63.92 24.5,61.02 23.92,60.44 23.92,59.49 v1(23.79,59.36)
DIGITAL_IN_0: length 61.9
  Top Layer w0.254: LED0.1 58.83,93.99 C15.2 63.43,93.99 R9.2 63.51,93.95 v1(64.53,92.93)
  Bottom Layer w0.254: v1(64.53,92.93) 64.65,92.93 66.54,91.05 75.29,91.05 87,79.33 87,64.7 87.61,64.09 87.61,62.82 86.66,61.87 85.19,61.87 84.85,61.53 84.85,61.27 83.84,60.26 83.84,59.77 84.06,59.55 84.06,58.72 86.08,56.7 CN2.6
DIGITAL_IN_0_LIMITER: length 18
  Top Layer w0.254: RN1.4 52.29,78.51 v1(52.29,89.64) ; v1(54.07,91.21) 56.61,93.75 LED0.2
  Bottom Layer w0.254: v1(52.29,89.64) 53.87,91.21 v1(54.07,91.21)
DIGITAL_IN_0_SAFE: length 95.6
  Top Layer w0.254: U1.39 37.26,96.32 v1(37.51,96.57) ; v1(68.66,81.86) 68.66,86.6 C19.2 65.57,91.85 65.51,91.91 R9.1 ; 75.39,66.37 75.39,66.87 v1(74.76,67.51)
  Bottom Layer w0.254: v1(68.66,81.86) 68.66,73.6 v1(74.76,67.51) 74.06,67.51 68.24,73.33 68.24,78.04 67.23,79.05 67.23,86.41 66.04,87.6 65.71,87.6 65.37,87.95 65.37,88.43 65.23,88.57 58.97,88.57 54.27,93.27 54.27,96.32 52.62,97.97 38.9,97.97 v1(37.51,96.57)
DIGITAL_IN_1: length 58.8
  Top Layer w0.254: R10.2 60.77,86.77 60.63,86.62 ; 60.63,86.62 60.27,86.26 60.27,81.43 61.13,80.57 64.05,80.57 64.54,80.08 64.54,78.47 64.38,78.31 64.38,78.08 64.54,77.92 64.54,76.27 v1(64.71,76.1) ; 60.63,86.62 58.7,86.62 LED1.1 ; 60.63,86.62 C16.2 62.54,86.62 62.68,86.77
  Bottom Layer w0.254: v1(64.71,76.1) 67.51,73.31 67.51,63.15 73.09,57.56 76.65,57.56 82.76,51.45 CN2.5
DIGITAL_IN_1_LIMITER: length 11.5
  Top Layer w0.254: RN1.3 51.91,77.24 52.17,77.24 56.48,81.56 LED1.2
DIGITAL_IN_1_SAFE: length 95.7
  Top Layer w0.254: v1(36.11,94.28) 35.34,95.05 U1.38 ; v1(77.39,64.95) 75.54,64.95 75.39,65.1 75.65,65.1 76.66,66.11 76.66,66.62 66.76,76.53 66.76,81.01 C20.2 R10.1 ; v1(36.11,89.71) 38.4,87.43 50.33,87.43 v1(50.84,87.93) ; v1(53.13,87.93) 53.38,88.19 v1(65.95,88.19)
  Bottom Layer w0.254: v1(77.39,64.95) 77.39,69.58 69.26,77.71 69.26,84.89 v1(65.95,88.19) ; v1(53.13,87.93) v1(50.84,87.93) ; v1(36.11,89.71) v1(36.11,94.28)
DIGITAL_IN_2: length 54
  Top Layer w0.254: 59.08,79.13 LED2.1 ; 59.08,79.13 59.61,78.61 59.61,74.73 61.46,72.87 66.42,72.87 72.84,66.45 v1(72.84,63.65) ; 59.08,79.13 C17.2 61.79,79.27 R11.2
  Bottom Layer w0.254: v1(72.84,63.65) 83.38,53.11 86.59,53.11 87.86,51.84 87.86,49.23 CN2.4
DIGITAL_IN_2_LIMITER: length 6
  Top Layer w0.254: RN1.2 53.95,76.48 LED2.2
DIGITAL_IN_2_SAFE: length 94.8
  Top Layer w0.254: v1(50.59,80.7) 50.59,82.98 v1(47.92,85.65) ; v1(62.27,73.46) 66.46,73.46 73.2,66.72 73.2,64.95 74.34,63.8 75.37,63.8 75.39,63.83 75.05,63.83 73.7,65.17 73.7,66.82 C21.2 R11.1 ; U1.6 16.47,91.78 16.8,91.78 16.96,91.95 16.99,91.95 18.63,93.58 v1(25.54,93.58)
  Bottom Layer w0.254: v1(47.92,85.65) 45,88.57 31.03,88.57 26.02,93.58 v1(25.54,93.58) ; v1(50.59,80.7) 57.83,73.46 v1(62.27,73.46)
DIGITAL_IN_3: length 44.6
  Top Layer w0.254: v1(64.85,70.77) R8.2 63.69,71.64 C14.2 58.97,71.64 LED3.1
  Bottom Layer w0.254: v1(64.85,70.77) 64.85,65.18 72.98,57.05 76.54,57.05 84.41,49.18 84.41,45.13 CN2.3
DIGITAL_IN_3_LIMITER: length 6.5
  Top Layer w0.254: LED3.2 55.88,71.68 RN1.1
DIGITAL_IN_3_SAFE: length 89.4
  Top Layer w0.254: 69.7,66.34 69.7,65.9 73.05,62.56 75.39,62.56 ; 69.7,66.34 68.58,67.46 C18.2 65.82,71.77 R8.1 ; 69.7,66.34 58.05,66.34 46.52,77.87 46.52,84.51 45.13,85.9 38.62,85.9 v1(34.68,89.84) ; U1.7 16.47,90.51 16.8,90.51 16.96,90.68 16.96,91 17.71,91.75 v1(18.55,91.75)
  Bottom Layer w0.254: v1(18.55,91.75) 19.19,92.38 19.19,93.4 20.33,94.54 25.66,94.54 27.69,92.51 33.92,92.51 34.09,92.33 34.09,92.27 34.44,91.93 34.5,91.93 34.68,91.75 v1(34.68,89.84)
DIGITAL_IN_4: length 45
  Top Layer w0.254: C22.2 63.81,64.53 R16.2 ; C22.2 58.95,64.53 LED4.1 ; C22.2 62.54,63.76 67.87,63.76 v1(68.12,63.51)
  Bottom Layer w0.254: CN2.21 94.08,55.07 90.92,51.9 89.39,51.9 87.61,53.67 85.58,53.67 74.98,64.27 68.89,64.27 v1(68.12,63.51)
DIGITAL_IN_4_LIMITER: length 9.5
  Top Layer w0.254: LED4.2 52.33,60.13 RN2.4
DIGITAL_IN_4_SAFE: length 88.9
  Top Layer w0.254: 68.53,60.52 69.3,60.52 70.06,61.29 73.4,61.29 ; 68.53,60.52 68.79,60.78 68.79,63.74 67.79,64.73 R16.1 ; 68.53,60.52 66.12,60.52 C27.2 66.08,62.51 66.01,62.57 ; 73.4,61.29 68.75,65.94 50.33,65.94 39.89,76.38 v1(27.6,76.38) ; 73.4,61.29 75.39,61.29 ; v1(18.46,77.65) 18.46,77.39 v1(20.62,75.23) ; v1(17.69,83.11) 17.18,83.62 U1.12
  Bottom Layer w0.254: v1(20.62,75.23) 26.46,75.23 v1(27.6,76.38) ; v1(17.69,83.11) 18.46,82.35 v1(18.46,77.65)
DIGITAL_IN_5: length 46.9
  Top Layer w0.254: 63.65,57.16 C23.2 58.7,57.16 LED5.1 ; R17.2 v1(64.66,56.14) ; v1(80.78,45.74) 88.37,45.74 88.56,45.55 88.56,44.82 89.45,43.92 90.72,43.92 91.61,44.82 91.61,47.55 92.41,48.35 92.41,49.78 CN2.20
  Bottom Layer w0.254: v1(80.78,45.74) 75.07,45.74 v1(64.66,56.14)
DIGITAL_IN_5_LIMITER: length 4.6
  Top Layer w0.254: RN2.3 55.39,56.08 LED5.2
DIGITAL_IN_5_SAFE: length 80.4
  Top Layer w0.254: 74.74,60.02 73.98,60.02 72.69,58.72 63.07,58.72 57.52,64.27 57.52,65.29 57.22,65.58 50.11,65.58 40.08,75.62 v1(29.38,75.62) ; 74.74,60.02 75.39,60.02 ; 74.74,60.02 72.94,58.22 66.7,58.22 R17.1 65.65,52.91 C28.2 ; v1(20.87,77.9) 20.23,78.54 U1.17
  Bottom Layer w0.254: v1(20.87,77.9) 27.09,77.9 v1(29.38,75.62)
DIGITAL_IN_6: length 48.7
  Top Layer w0.254: 58.57,49.54 59.76,48.35 59.76,44.85 60.2,44.41 67.9,44.41 68.51,45.02 86.68,45.02 88.13,43.57 90.87,43.57 91.97,44.67 91.97,47.41 92.02,47.45 CN2.19 ; 58.57,49.54 C24.2 63.3,49.54 R20.2 ; 58.57,49.54 LED6.1
DIGITAL_IN_6_LIMITER: length 7.6
  Top Layer w0.254: RN2.2 52.67,55.28 53.82,54.13 53.82,52.1 LED6.2
DIGITAL_IN_6_SAFE: length 106.5
  Top Layer w0.254: v1(20.62,71.93) 20.62,73.2 v1(15.73,78.09) ; v1(53.55,60.14) 55.07,60.14 57.36,57.86 57.36,56.84 62.44,51.76 66.99,51.76 74.08,58.85 75.29,58.85 75.39,58.75 74.48,58.75 65.49,49.75 65.49,49.73 R20.1 C29.2 ; v1(50.75,62.56) 49.93,62.56 40.55,71.93 v1(26.97,71.93) ; U1.8 15.92,88.7 14.52,88.7 13.25,87.43 v1(13.25,84.38)
  Bottom Layer w0.254: v1(15.73,78.09) 13.25,80.57 v1(13.25,84.38) ; v1(53.55,60.14) 53.17,60.14 v1(50.75,62.56) ; v1(20.62,71.93) v1(26.97,71.93)
DIGITAL_IN_7: length 42
  Top Layer w0.254: LED7.1 58.7,42.17 C25.2 ; CN2.18 94.08,43.24 90.74,39.9 88.71,39.9 86.68,37.87 70.67,37.87 67.37,41.17 62.27,41.17 C25.2 ; C25.2 63.3,42.17 R21.2
DIGITAL_IN_7_LIMITER: length 13.8
  Top Layer w0.254: LED7.2 53.31,45.37 53.31,53.5 RN2.1
DIGITAL_IN_7_SAFE: length 115
  Top Layer w0.254: v1(66.39,42.49) 65.61,42.49 R21.1 ; C30.2 65.44,40.16 65.74,40.46 v1(66.39,40.46) ; v1(68.24,48.18) 68.5,48.18 68.88,47.8 70.42,47.8 76.65,54.03 76.65,54.05 79.92,57.33 ; v1(29.3,81.1) 27.16,83.23 25.48,83.23 22.17,86.54 17.14,86.54 16.25,87.43 U1.9 ; v1(67.78,46.93) 68.14,47.29 70.68,47.29 D5.9
  Bottom Layer w0.254: v1(67.78,46.93) 67.75,46.93 66.72,45.9 66.72,42.82 v1(66.39,42.49) v1(66.39,40.46) ; v1(29.3,81.1) 29.3,80.08 62.72,46.66 66.46,46.66 67.99,48.18 v1(68.24,48.18)
DIGITAL_IN_8: length 61.7
  Top Layer w0.254: LED8.1 58.71,34.94 C26.2 63.43,34.94 R22.2 65.54,37.05 86.62,37.05 88.95,39.38 90.99,39.38 93.53,41.92 94.8,41.92 95.81,42.94 95.81,61.73 CN2.23
DIGITAL_IN_8_LIMITER: length 19
  Top Layer w0.254: LED8.2 52.3,39.15 R7.1
DIGITAL_IN_8_SAFE: length 115.6
  Top Layer w0.254: D5.10 80.61,58.75 76.29,54.43 76.16,54.43 v1(70.32,48.59) ; v1(65.62,36.14) 65.62,35.13 R22.1 65.55,32.78 ; U1.10 20.43,86.16 25.24,81.35 v1(25.24,81.1) ; 65.55,32.78 65.55,30.87 C31.2 ; 65.55,32.78 65.5,32.88
  Bottom Layer w0.254: v1(25.24,81.1) 65.8,40.53 65.8,40.22 66.14,39.87 66.63,39.87 66.97,40.22 66.97,41.8 67.23,42.06 67.23,45.49 v1(70.32,48.59) 70.32,47.82 67.78,45.28 67.78,40.08 66.39,38.68 65.62,38.68 v1(65.62,36.14)
DIGITAL_OUT_0: length 85.7
  Top Layer w0.254: v1(20.67,84.91) 15.95,84.91 U1.11 ; v1(67.4,78.05) 80.36,65.1 D5.15 81.63,65.1 v1(85.44,61.29)
  Bottom Layer w0.254: v1(20.67,84.91) 60.54,84.91 v1(67.4,78.05) ; CN2.14 89.4,58.14 89.4,58.34 86.45,61.29 v1(85.44,61.29)
DIGITAL_OUT_1: length 77
  Top Layer w0.254: v1(27.6,80.92) 27.6,80.06 U1.23 ; v1(67.4,77.03) 80.61,63.83 D5.14 81.12,63.83 84.42,60.52 v1(84.42,60.02)
  Bottom Layer w0.254: v1(67.4,77.03) 62.75,81.68 28.11,81.68 27.6,81.17 v1(27.6,80.92) ; CN2.13 90.01,53.53 90.01,53.78 86.71,57.09 86.2,57.09 84.42,58.86 v1(84.42,60.02)
EN: length 42.6
  Top Layer w0.254: 15.92,95.05 15.6,95.05 9.5,88.95 R4.2 6.32,88.89 C1.1 6.32,83.81 6.77,83.36 6.77,81.58 3.57,78.38 3.57,77.54 3.06,77.03 2.22,77.03 1.06,75.87 v1(1.06,65.96)
  Bottom Layer w0.254: H1.6 2.84,64.19 v1(1.06,65.96)
FUELSENDER: length 92
  Top Layer w0.254: R32.1 27.73,31.67 26.04,33.36 26.04,35.46 C38.2
  Bottom Layer w0.254: R32.1 28.15,31.29 33.99,31.29 35.14,32.44 75.78,32.44 84.92,41.58 86.7,41.58 88.48,43.36 88.48,49.88 88.51,49.91 88.51,50.11 89.43,51.03 90.74,51.03 90.91,50.86 91.11,50.86 94.05,53.8 94.72,53.8 95.61,54.69 95.61,54.75 95.66,54.8 95.66,56.11 94.08,57.68 CN2.22
MISO: length 29.4
  Top Layer w0.254: U4.10 17.13,55.93 v1(17.13,58.22) ; v1(23.79,61.26) 24.77,62.25 24.77,78.38 25.31,78.92 U1.21
  Bottom Layer w0.254: v1(17.13,58.22) 17.64,58.72 20.25,58.72 22.79,61.26 v1(23.79,61.26)
MOSI: length 26.7
  Top Layer w0.254: U4.9 18.46,57.45 19.09,58.09 20.74,58.09 22.77,60.12 U1.19
RX: length 53.1
  Top Layer w0.254: v1(26.84,66.98) 26.72,67.09 26.72,71.35 26.38,71.69 26.38,75.98 27.36,76.96 28.3,76.96 30.39,79.06 U1.25 ; v1(18.58,65.96) 18.58,65.84 8.65,55.91 8.65,46.77 4.83,42.95 H3.2
  Bottom Layer w0.254: v1(18.58,65.96) 25.82,65.96 v1(26.84,66.98)
RXD0: length 48.6
  Top Layer w0.254: U1.36 33.07,92.51 26.08,85.52 v1(26.08,84.25)
  Bottom Layer w0.254: H1.4 4.74,59.98 5.92,61.16 5.92,62.32 14.04,70.44 14.04,70.63 19.83,76.42 19.83,80.44 20.44,81.05 20.44,83.44 21.55,84.55 25.78,84.55 v1(26.08,84.25)
SCLK: length 29.9
  Top Layer w0.254: U1.20 23.79,79.55 v1(23.79,62.92) ; v1(16.04,59.49) 16.04,57.71 15.92,57.58 U4.11
  Bottom Layer w0.254: v1(23.79,62.92) 22.64,61.76 22.64,61.62 20.51,59.49 v1(16.04,59.49)
TX: length 53.4
  Top Layer w0.254: v1(19.98,67.87) 19.98,66.53 18.83,65.38 18.63,65.38 9.06,55.81 9.06,44.19 H3.3 ; v1(25.91,68.03) 25.91,76.03 29.12,79.25 U1.24
  Bottom Layer w0.254: v1(25.91,68.03) 25.75,67.87 v1(19.98,67.87)
TXD0: length 46.8
  Top Layer w0.254: U1.37 33.05,93.78 v1(26.2,86.94)
  Bottom Layer w0.254: H1.5 13.68,70.59 13.68,70.78 19.47,76.57 19.47,80.59 20.08,81.19 20.08,85.15 20.96,86.03 25.3,86.03 v1(26.2,86.94)
USB_D+: length 8.4
  Top Layer w0.178: 8.41,72.83 8.92,72.83 9.06,72.69 9.18,72.69 9.27,72.78 9.27,73.29 9.44,73.46 9.56,73.46 9.83,73.2 9.83,72.44 10.08,72.19 10.46,72.19 10.54,72.27 10.54,72.46 D1.1 ; 8.41,72.83 USB1.B6 ; 8.41,72.83 8.58,73.01 8.58,73.78 8.49,73.87 7.38,73.87 USB1.A6
USB_D+_PROTECTED: length 8.3
  Top Layer w0.178: v1(11.85,76.89) 11.28,76.32 D1.6 ; v1(13.76,78.16) 13.76,79.55 15.29,81.08 U1.14
  Bottom Layer w0.178: v1(11.85,76.89) 11.97,76.89 13.24,78.16 v1(13.76,78.16)
USB_D-: length 9
  Top Layer w0.178: USB1.A7 6.7,73.33 6.45,73.58 6.45,74.15 6.65,74.34 7.33,74.34 USB1.B7 7.45,74.22 12.35,74.22 13.18,73.39 D1.3
USB_D-_PROTECTED: length 8.2
  Top Layer w0.178: D1.4 13.18,79.61 14.94,81.36 14.94,81.63 15.08,81.77 15.35,81.77 U1.13
$1N19184: length 4.7
  Top Layer w0.254: 51.46,91.24 51.46,92.9 H2.1
$1N26408: length 9.3
  Top Layer w0.254: 80.19,7.84 Q1.1 80.19,8.55 77,11.73 75.73,11.73 76.26,12.26 78.15,12.26 78.27,12.13
$4N352: length 5
  Top Layer w0.254: R34.1 R36.1 42.5,36.99 C40.2
$4N509: length 5.2
  Top Layer w0.254: C41.2 42.5,33.47 R37.1 R35.1
$5N952: length 5.6
  Top Layer w0.254: USB1.A5 8.23,74.83 10.46,77.06 10.46,78.42 10.33,78.54
$5N991: length 5.9
  Top Layer w0.254: USB1.B5 9.41,71.83 11.14,70.11 11.14,68.78 R1.2

## Copper pours and planes (outline as drawn; the poured copper is in the pictures)
+3V3 on Top Layer: 37.25,91.36 39.67,91.36 39.67,90.47 37.25,90.47
+3V3 on Top Layer: 31.38,52.86 34.04,52.86 34.04,51.33 31.38,51.33
+3V3 on Top Layer: 6.52,28.62 10.01,28.62 10.01,24.66 6.52,24.66
+3V3 on Top Layer: 2.33,89.97 5.38,89.97 5.38,87.84 2.33,87.84
+3V3 on Top Layer: 37.7,41.2 35.03,41.2 35.03,46.28 37.7,46.28
+3V3 on Top Layer: 79.77,71.29 83.89,71.29 83.89,65.68 79.77,65.68
+3V3 on Top Layer: 31.36,57.2 34.03,57.2 34.03,55.68 31.36,55.68
+3V3 on Top Layer: 8.42,93.9 14.09,93.9 14.09,94.62 15.28,95.81 16.13,95.81 16.13,96.76 14.71,96.76 13.63,95.68 8.42,95.68
+3V3 on Top Layer: 11.6,57.07 13.92,57.07 13.92,54.03 11.6,54.03
+3V3 on Top Layer: 42.05,27.39 42.05,30.06 43.58,30.06 43.58,27.39
+3V3 on Top Layer: 45.19,39.93 42.52,39.93 42.52,41.45 45.19,41.45
+3V3 on Top Layer: 40.17,97.33 42.21,97.33 42.21,94.57 40.17,94.57
+3V3 on Top Layer: 31.41,48.44 34.08,48.44 34.08,46.91 31.41,46.91
+3V3 on Top Layer: 40.81,84.38 43.86,84.38 43.86,82.09 40.81,82.09
+3V3 on Inner2: -7.07,24.69 77.82,24.69 82.97,29.77 82.59,103.05 -7.07,103.05
+5V on Top Layer: 61.51,23.29 65.32,23.29 65.32,19.61 61.51,19.61
+5V on Top Layer: 14.14,17.58 19.85,17.58 19.85,14.78 14.14,14.78
+5V on Top Layer: 13.89,9.96 37,9.96 37,0.3 13.89,0.3
+5V on Inner2: 36.74,-2.49 36.74,8.56 46.78,18.59 81.32,18.59 88.31,25.58 88.31,39.59 87.11,41.58 82.95,41.58 83.09,29.5 78.14,24.35 14.01,24.35 14.01,-2.49
+12VFUSED on Top Layer: 73.58,12.88 86.53,12.88 86.53,0.3 73.58,0.3
+12VFUSED on Inner2: 73.54,-0.59 73.54,12.85 86.91,12.85 86.91,-0.59
+12VIGN on Top Layer: 87.42,9.83 91.36,9.83 91.36,7.03 87.42,7.03
+12VIGN on Inner2: 86.91,-1.22 86.91,17.63 92.51,22.97 92.51,37.39 99.36,37.39 99.36,-1.22
+12VPROTECTED on Top Layer: 66.34,12.88 73.45,12.88 73.45,0.3 66.34,0.3
+12VPROTECTED on Top Layer: 71.54,9.7 76.62,9.7 76.62,6.78 71.54,6.78
+12VPROTECTED on Inner2: 66.33,12.88 73.45,12.88 73.45,-0.97 66.33,-0.97
+12VPROTECTED_L on Top Layer: 66.08,-1.73 59.35,-1.73 55.8,1.83 55.8,7.01 55.77,7.03 48.3,7.03 48.3,-1.09 41.7,-1.09 41.7,12.93 66.08,12.93
+12VPROTECTED_L on Inner2: 66.33,12.88 66.33,-5.16 59.48,-5.16 59.48,7.03 58.46,8.05 47.29,8.05 45.64,6.4 45.64,-4.78 41.57,-4.78 41.57,8.43 46.02,12.88
GND on Top Layer: 27.93,38.66 30.57,38.66 30.57,34.59 27.93,34.59
GND on Top Layer: 42.46,97.21 45.89,97.21 45.89,93.01 42.46,93.01
GND on Top Layer: 60.26,85.52 64.05,85.52 64.05,81.57 60.26,81.57
GND on Top Layer: 37,8.31 41.57,8.31 41.57,0.3 37,0.3
GND on Top Layer: 38.52,37.64 41.5,37.64 41.5,32.9 38.52,32.9
GND on Top Layer: 60.35,92.71 64.4,92.71 64.4,89.03 60.35,89.03
GND on Top Layer: 77.13,71.3 79.71,71.3 79.71,68.53 77.13,68.53
GND on Top Layer: 9.63,83.4 11.54,83.4 11.54,80.09 9.63,80.09
GND on Top Layer: 11.73,73.84 12.74,73.84 12.74,71.68 11.73,71.68
GND on Top Layer: 8.68,98.48 16.94,98.48 16.94,96.96 8.68,96.96
GND on Top Layer: 10.07,67.5 11.98,67.5 11.98,64.19 10.07,64.19
GND on Top Layer: 6.71,70.79 9.63,70.79 9.63,69.77 6.71,69.77
GND on Top Layer: 60.52,70.54 64.37,70.54 64.37,66.78 60.52,66.78
GND on Top Layer: 49.45,58.57 50.98,58.57 50.98,51.23 49.45,51.23
GND on Top Layer: 20.84,46.45 20.84,43.4 11.31,43.4 11.31,46.45
GND on Top Layer: 31.28,98.6 34.33,98.6 34.33,96.06 31.28,96.06
GND on Top Layer: -26.25,100.51 124.12,100.51 124.12,-1.35 -26.25,-1.35
GND on Top Layer: 60.25,48.41 64.09,48.41 64.09,44.61 60.25,44.61
GND on Top Layer: 60.19,41.33 64.18,41.33 64.18,37.26 60.19,37.26
GND on Top Layer: 60.39,56.12 64.29,56.12 64.29,52.11 60.39,52.11
GND on Top Layer: 37.25,92.63 39.91,92.63 39.91,91.66 37.25,91.66
GND on Top Layer: 78.02,81.97 80.43,81.97 80.43,79.93 78.02,79.93
GND on Top Layer: 49.45,18.08 86.53,18.08 86.53,13.26 49.45,13.26
GND on Top Layer: 10.46,28.5 13.7,28.5 13.7,26.19 10.46,26.19
GND on Top Layer: 6.71,77.21 9.63,77.21 9.63,76.31 6.71,76.31
GND on Top Layer: 60.76,78.13 64.37,78.13 64.37,74.08 60.76,74.08
GND on Top Layer: 60.52,63.82 64.71,63.82 64.71,59.6 60.52,59.6
GND on Top Layer: 60.25,33.81 64.22,33.81 64.22,30.01 60.25,30.01
GND on Top Layer: 77.85,63.41 77.85,67.54 79.55,67.54 79.55,63.41
GND on Top Layer: 42.57,56.08 45.86,56.08 45.86,48.91 42.57,48.91
GND on Top Layer: 9.57,22.91 10.58,22.91 10.58,22.4 11.22,21.77 11.22,20.37 9.57,20.37
GND on Top Layer: 48.7,80.18 50.24,80.18 50.24,74.48 48.7,74.48
GND on Bottom Layer: -3.01,100.76 103.17,100.76 103.17,-0.71 -3.01,-0.71
GND on Inner1: -2.88,100.89 102.02,100.89 102.02,-1.09 -2.88,-1.09
GND on Inner2: -1.23,14.15 14.39,14.15 14.39,-1.6 -1.23,-1.6
GND on Inner2: 81.45,18.34 88.56,25.45 92.37,23.04 86.66,17.69 86.66,13.13 46.6,13.13 41.83,8.57 41.83,-2.87 36.87,-2.87 36.87,8.31 46.9,18.34
GND on Inner2: 92.54,37.52 92.37,23.04 88.56,25.45 88.56,39.42 87.06,41.83 83.1,41.83 83.1,98.73 99.61,98.73 99.61,37.52
+5LDO on Top Layer: 2.07,22.98 4.87,22.98 4.87,16.94 2.07,16.94
+5LDO on Top Layer: 5.63,23.8 9.44,23.8 9.44,21.26 5.63,21.26
+5LDO on Top Layer: 8.04,17.7 13.2,17.7 13.2,14.8 8.04,14.8
+5LDO on Inner2: -0.91,24.3 13.76,24.3 13.76,13.89 -0.91,13.89

## Text on the board
Top Silkscreen Layer: GND | +5V | EN | TXD0 | RXD0 | 3V3 | 3v3 | RX | TX | BOOT | CAN 120R | 5V | 5V / Regulator | FTDI | GPS | Indeterminate Design / CAN IO Module v1.0
